# Altium schematic sheet AC_SWITH.SchDoc
size A4
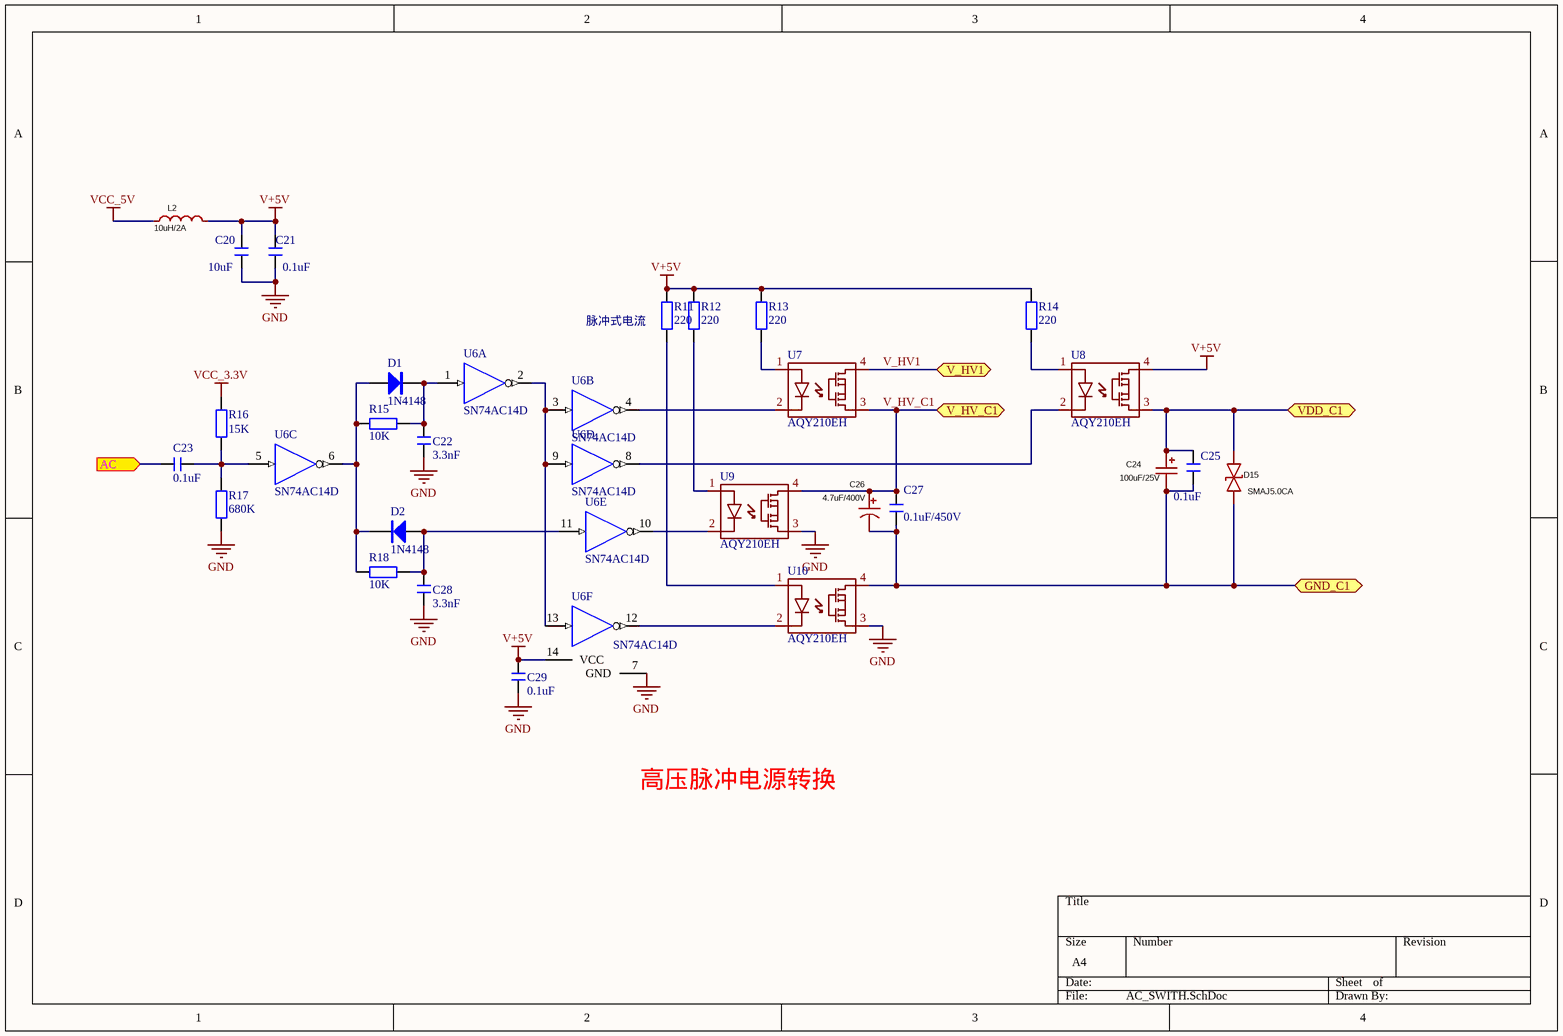
[diagram p0: AC_SWITH.SchDoc]

## Parts
C20  10uF  [C 0805]
C21  0.1uF  [C 0603]
C22  3.3nF  [C 0603]
C23  0.1uF  [C 0603]
C24  100uF/25V  [CASE-D_7343]
C25  0.1uF  [C 0603]
C26  4.7uF/400V  [CAP-TH_BD8.0-P3.50-D0.6-FD]
C27  0.1uF/450V  [C 1206]
C28  3.3nF  [C 0603]
C29  0.1uF  [C 0603]
D1  1N4148  [SOD-323]
D2  1N4148  [SOD-323]
D15  SMAJ5.0CA  [SMA_L4.4-W2.6-LS5.0-BI]
L2  10uH/2A  [IND-SMD_L5.0-W5.0_LQH5BPBXX]
R11  220  [R 0603]
R12  220  [R 0603]
R13  220  [R 0603]
R14  220  [R 0603]
R15  10K  [R 0603]
R16  15K  [R 0603]
R17  680K  [R 0603]
R18  10K  [R 0603]
U6  SN74AC14D  [SOIC-14_L8.7-W3.9-P1.27-LS6.0-BL]  (parts A,B,C,D,E,F of 6)
U7  AQY210EH  [RELAY-SMD_AQY210EHAX]
U8  AQY210EH  [RELAY-SMD_AQY210EHAX]
U9  AQY210EH  [RELAY-SMD_AQY210EHAX]
U10  AQY210EH  [RELAY-SMD_AQY210EHAX]

## Ports
AC (in), GND_C1, V_HV1, V_HV_C1, VDD_C1

## Nets
GND: C20.1 C21.2 C22.2 C28.2 C29.2 R17.1 U6.7(GND) U9.3(A) U10.3(A)
V+5V: C20.2 C21.1 C29.1 L2.2 R11.1 R12.1 R13.1 R14.1 U6.14(VCC) U8.4(A)
VCC_3.3V: R16.2
VCC_5V: L2.1
AC: C23.2 ; port AC
GND_C1: C24.2 C25.2 C26.2 C27.1 D15.1 U10.4(A) ; port GND_C1
V_HV1: U7.4(A) ; port V_HV1
V_HV_C1: C26.1 C27.2 U7.3(A) U9.4(A) ; port V_HV_C1
VDD_C1: C24.1 C25.1 D15.2 U8.3(A) ; port VDD_C1
NetC22_1: C22.1 D1.2(K) R15.1 U6.1(A)
NetC23_1: C23.1 R16.1 R17.2 U6.5(A)
NetC28_1: C28.1 D2.1(A) R18.1 U6.11(A)
NetD1_1: D1.1(A) D2.2(K) R15.2 R18.2 U6.6(Y)
NetR11_2: R11.2 U10.1(A)
NetR12_2: R12.2 U9.1(A)
NetR13_2: R13.2 U7.1(A)
NetR14_2: R14.2 U8.1(A)
NetU6_2: U6.2(Y) U6.3(A) U6.9(A) U6.13(A)
NetU6_4: U6.4(Y) U7.2(A)
NetU6_8: U6.8(Y) U8.2(A)
NetU6_10: U6.10(Y) U9.2(A)
NetU6_12: U6.12(Y) U10.2(A)

## Notes on the sheet
- 脉冲式电流
- 高压脉冲电源转换

## Library data of the parts
C20-C23 C25 C27-C29 = C: 无极性贴片电容; 版权归属: 源创客; BOM名称: 无极性贴片电容; 学习资源: www.ooocke.com
C24 = TAJD107K016RNJ: Manufacturer: Kyocera AVX; Add into BOM: yes; Value: 100uF; Rated Voltage: 16V; Symbol: TAJD107K016RNJ; Device: TAJD107K016RNJ; Supplier Part: C7223; Manufacturer Part: TAJD107K016RNJ; Supplier Footprint: CASE-D-7343; JLCPCB Part Class: Extended Part; Datasheet: https://atta.szlcsc.com/upload/public/pdf/source/20160107/1457707750344.pdf; Supplier: LCSC; Convert to PCB: yes
C26 = ERK2GM4R7F09OT: Add into BOM: yes; Value: 4.7uF; Rated Voltage: 400V; Ripple Current: 94mA@100kHz; L: 9mm; Symbol: ERK2GM4R7F09OT; Device: ERK2GM4R7F09OT; Supplier Part: C112499; Manufacturer Part: ERK2GM4R7F09OT; JLCPCB Part Class: Extended Part; Datasheet: https://atta.szlcsc.com/upload/public/pdf/source/20200117/C486002_277F2A16EBB2F90C92EEA28887F58F34.pdf; Supplier: LCSC; Convert to PCB: yes; Equivalent Series Resistance(ESR): -; Lead Spacing: 3.5mm
D1 D2 = 1N4148: 高速开关二极管; 版权归属: 源创客; BOM名称: 高速开关二极管; 学习资源: www.ooocke.com
D15 = SMAJ5.0CA_C83324: Symbol: SMAJ5.0CA-C83324; Add into BOM: yes; Reverse Stand-Off Voltage (Vrwm): 5V; Maximum Clamping Voltage: 9.2V; Peak Pulse Current (Ipp)@10/1000us: 43.5A; Peak Pulse Power Dissipation (Ppp)@10/1000us: 400W; Breakdown Voltage: 6.4V; Type: TVS; Device: SMAJ5.0CA_C83324; Supplier Part: C83324; Manufacturer Part: SMAJ5.0CA; Supplier Footprint: SMA(DO-214AC); JLCPCB Part Class: Extended Part; Datasheet: https://atta.szlcsc.com/upload/public/pdf/source/20190402/C374025_5ACE77BC72947DF13CF0CBC7F8B57228.pdf; Supplier: LCSC; Convert to PCB: yes
L2 = LQH5BPB100MT0L: Add into BOM: yes; Value: 10uH; Rated Current: 1.6A; Saturation Current (Isat): 2A; Symbol: LQH5BPB100MT0L; Device: LQH5BPB100MT0L; Supplier Part: C521243; Manufacturer Part: LQH5BPB100MT0L; Supplier Footprint: SMD,5x5mm; JLCPCB Part Class: Extended Part; Datasheet: https://atta.szlcsc.com/upload/public/pdf/source/20200424/C521243_DFE491869978DAC178DAE514CEE77DDD.pdf; Supplier: LCSC; Convert to PCB: yes; Ratings: -
R11-R18 = R: 贴片电阻; 版权归属: 源创客; BOM名称: 贴片电阻; 学习资源: www.ooocke.com
U6 = SN74LS14D: Hex Schmitt-Trigger Inverter; Published: 8-Jun-2000; LatestRevisionDate: 13-Apr-2006; LatestRevisionNote: IPC-7351 Footprint Added.; DatasheetVersion: Mar-1988; PackageVersion: Jan-1998; PackageReference: D014; Publisher: Altium Limited; PackageDescription: 14-Pin Small Outline Integrated Circuit 1.27 mm Pitch; Code_IPC: SOIC127P600-14; ComponentLink1Description: Manufacturer Link; ComponentLink1URL: http://www.ti.com/; ComponentLink2Description: Datasheet; ComponentLink2URL: http://www-s.ti.com/sc/ds/sn74ls14.pdf